# Altium schematic sheet 5V_and_3V3_Regulation.SchDoc
size 431 x 279 mm; SheetNumber: 2; SheetTotal: 5
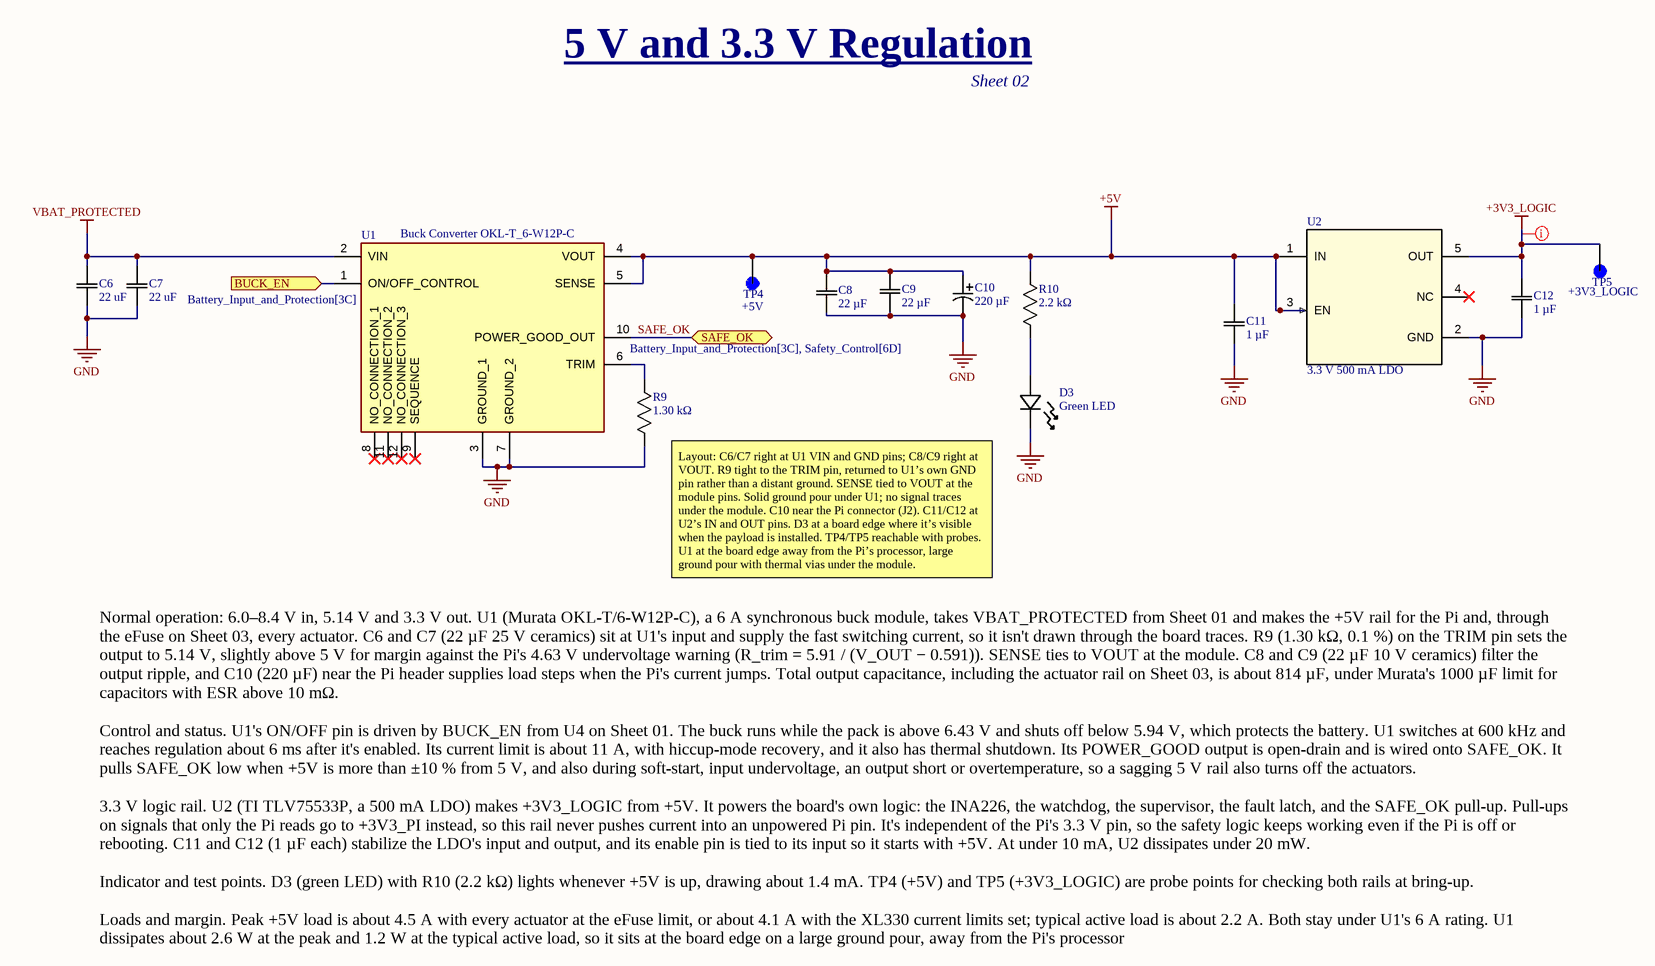
[diagram p0: 5V_and_3V3_Regulation.SchDoc]

## Parts
C6  22 uF  [G-32_MUR]
C7  22 uF  [G-32_MUR]
C8  22 µF  [CAP_GRM32ED_MUR]
C9  22 µF  [CAP_GRM32ED_MUR]
C10  220 µF  [CAP_EEFK_D_PAN]
C11  1 µF  [G-188_MUR]
C12  1 µF  [G-188_MUR]
D3  Green LED  [LED_LTST-C191KGKT_LTO]
R9  1.30 kΩ  [RC0603N_YAG]
R10  2.2 kΩ  [RC0603N_YAG]
TP4  +5V  [KEYSTONE_5015]
TP5  +3V3_LOGIC  [KEYSTONE_5015]
U1  Buck Converter OKL-T_6-W12P-C  [OKLT6W12PC]
U2  3.3 V 500 mA LDO  [DBV0005A_N]

## Ports
BUCK_EN (in, see Battery_Input_and_Protection[3C]), SAFE_OK (bidir, see Battery_Input_and_Protection[3C], Safety_Control[6D])

## Nets
+3V3_LOGIC: C12.1 TP5.TP U2.5(OUT)
+5V: C8.2 C9.2 C10.1 C11.1 R10.2 TP4.TP U1.4(VOUT) U1.5(SENSE) U2.1(IN) U2.3(EN)
GND: C6.2 C7.2 C8.1 C9.1 C10.2 C11.2 C12.2 D3.1(CATHODE) R9.2 U1.3(GROUND_1) U1.7(GROUND_2) U2.2(GND)
VBAT_PROTECTED: C6.1 C7.1 U1.2(VIN)
BUCK_EN: U1.1(ON/OFF_CONTROL) ; port BUCK_EN
SAFE_OK: U1.10(POWER_GOOD_OUT) ; port SAFE_OK
NetD3_2: D3.2(ANODE) R10.1
NetR9_1: R9.1 U1.6(TRIM)

Not connected (* = marked no-connect by the designer): U1 8(NO_CONNECTION_1)* 9(SEQUENCE)* 11(NO_CONNECTION_2)* 12(NO_CONNECTION_3)*; U2 4(NC)*

## Layout directives
net class POWER_LO: +3V3_LOGIC

## Notes on the sheet
- 5 V and 3.3 V Regulation
- Sheet 02
- Layout: C6/C7 right at U1 VIN and GND pins; C8/C9 right at VOUT. R9 tight to the TRIM pin, returned to U1’s own GND pin rather than a distant ground. SENSE tied to VOUT at the module pins. Solid ground pour under U1; no signal traces under the module. C10 near the Pi connector (J2). C11/C12 at U2’s IN and OUT pins. D3 at a board edge where it’s visible when the payload is installed. TP4/TP5 reachable with probes. U1 at the board edge away from the Pi’s processor, large ground pour with thermal vias under the module.
- Normal operation: 6.0–8.4 V in, 5.14 V and 3.3 V out. U1 (Murata OKL-T/6-W12P-C), a 6 A synchronous buck module, takes VBAT_PROTECTED from Sheet 01 and makes the +5V rail for the Pi and, through the eFuse on Sheet 03, every actuator. C6 and C7 (22 µF 25 V ceramics) sit at U1's input and supply the fast switching current, so it isn't drawn through the board traces. R9 (1.30 kΩ, 0.1 %) on the TRIM pin sets the output to 5.14 V, slightly above 5 V for margin against the Pi's 4.63 V undervoltage warning (R_trim = 5.91 / (V_OUT − 0.591)). SENSE ties to VOUT at the module. C8 and C9 (22 µF 10 V ceramics) filter the output ripple, and C10 (220 µF) near the Pi header supplies load steps when the Pi's current jumps. Total output capacitance, including the actuator rail on Sheet 03, is about 814 µF, under Murata's 1000 µF limit for capacitors with ESR above 10 mΩ.
  Control and status. U1's ON/OFF pin is driven by BUCK_EN from U4 on Sheet 01. The buck runs while the pack is above 6.43 V and shuts off below 5.94 V, which protects the battery. U1 switches at 600 kHz and reaches regulation about 6 ms after it's enabled. Its current limit is about 11 A, with hiccup-mode recovery, and it also has thermal shutdown. Its POWER_GOOD output is open-drain and is wired onto SAFE_OK. It pulls SAFE_OK low when +5V is more than ±10 % from 5 V, and also during soft-start, input undervoltage, an output short or overtemperature, so a sagging 5 V rail also turns off the actuators.
  3.3 V logic rail. U2 (TI TLV75533P, a 500 mA LDO) makes +3V3_LOGIC from +5V. It powers the board's own logic: the INA226, the watchdog, the supervisor, the fault latch, and the SAFE_OK pull-up. Pull-ups on signals that only the Pi reads go to +3V3_PI instead, so this rail never pushes current into an unpowered Pi pin. It's independent of the Pi's 3.3 V pin, so the safety logic keeps working even if the Pi is off or rebooting. C11 and C12 (1 µF each) stabilize the LDO's input and output, and its enable pin is tied to its input so it starts with +5V. At under 10 mA, U2 dissipates under 20 mW.
  Indicator and test points. D3 (green LED) with R10 (2.2 kΩ) lights whenever +5V is up, drawing about 1.4 mA. TP4 (+5V) and TP5 (+3V3_LOGIC) are probe points for checking both rails at bring-up.
  Loads and margin. Peak +5V load is about 4.5 A with every actuator at the eFuse limit, or about 4.1 A with the XL330 current limits set; typical active load is about 2.2 A. Both stay under U1's 6 A rating. U1 dissipates about 2.6 W at the peak and 1.2 W at the typical active load, so it sits at the board edge on a large ground pour, away from the Pi's processor
- DWG. NO.
- REV.
- SHT.
- THIS DOCUMENT AND THE DATA DISCLOSED HEREIN OR HEREWITH IS THE PROPERTY OF ALTIUM LIMITED AND MAY BE FREELY DISTRIBUTED IN WHOLE. NO RIGHTS ARE RESERVED OR EXPRESS OR IMPLIED WARANTEE GIVEN.
- REVISION
- DESCRIPTION
- DATE
- APPROVED
- ENG:
- APPROVALS
- PROJECT
- DSN:
- CHK:
- REFERENCE DOCUMENTS
- PROJECT REVISION:
- TITLE
- DOCUMENT REVISION:
- DESIGN ITEM:
- BOM:
- FAB DWG:
- PCB DWG:
- ASSY DWG:
- SCALE:
- SIZE
- B
- CAGE CODE
- FILE NAME
- DWG NO.
- SHEET
- OF
- REV

## Library data of the parts
C6 C7 = GRM32ER71E226KE15L: CAP, CERM, 22 uF, 25 V, +/- 10%, X7R, 1210 / Murata GRM32ER71E226KE15L / https://www.digikey.com/en/products/detail/murata-electronics/GRM32ER71E226KE15L/2039040; Copyright: Copyright (C) 2025 Ultra Librarian. All rights reserved.; Manufacturer_Name: Murata; Manufacturer_Part_Number: GRM32ER71E226KE15L
C8 C9 = GRM32ER71A226KE20L: Murata GRM32ER71A226KE20L / 22 µF 10 V X7R / https://www.digikey.com/en/products/detail/murata-electronics/GRM32ER71A226KE20L/586573; Copyright: Copyright (C) 2025 Ultra Librarian. All rights reserved.; Manufacturer_Name: Murata; Manufacturer_Part_Number: GRM32ER71A226KE20L
C10 = EEE-FK0J221P: Panasonic EEE-FK0J221P / 220 µF 6.3 V aluminum (total output C ≈ 734 µF, under the 1000 µF limit) / https://www.digikey.com/en/products/detail/panasonic-industry/EEE-FK0J221P/765937; Copyright: Copyright (C) 2026 Ultra Librarian. All rights reserved.; Manufacturer_Name: Panasonic; Manufacturer_Part_Number: EEE-FK0J221P
C11 C12 = GRM188R71A105KA61D: Murata GRM188R71A105KA61D / 1 µF 10 V X7R / https://www.digikey.com/en/products/detail/murata-electronics/GRM188R71A105KA61D/965913; Copyright: Copyright (C) 2025 Ultra Librarian. All rights reserved.; Manufacturer_Name: Murata; Manufacturer_Part_Number: GRM188R71A105KA61D
D3 = LTST-C191KGKT: Lite-On LTST-C191KGKT / Green LED / 0603 / https://www.digikey.com/en/products/detail/liteon/LTST-C191KGKT/386835; Type: LED Indication; Copyright: Copyright (C) 2025 Ultra Librarian. All rights reserved.; Manufacturer_Name: LITE-ON; Manufacturer_Part_Number: LTST-C191KGKT
R9 = RT0603BRD071K3L: Yageo RT0603BRD071K3L / 1.30 kΩ 0.1 % thin film (Murata asks ≤ 0.5 %, ≤ 100 ppm/°C) / 0603 / Output trim, 5.14 V / https://www.digikey.com/en/products/result?keywords=RT0603BRD071K3L; Copyright: Copyright (C) 2026 Ultra Librarian. All rights reserved.; Manufacturer_Name: Yageo; Manufacturer_Part_Number: RT0603BRD071K3L
R10 = RC0603FR-072K2L: RC0603FR-072K2L / 2.2 kΩ 1 % (~7 mW in D3) / 0603 / https://www.digikey.com/en/products/detail/yageo/RC0603FR-072K2L/727016; Manufacturer_Name: Yageo; Copyright: Copyright (C) 2025 Ultra Librarian. All rights reserved.; Manufacturer_Part_Number: RC0603FR-072K2L
TP4 TP5 = 5015: Test Point Micro Mini SMT Phos Bronze/Silver 1000pc Tape & Reel | Keystone Electronics 5015; SnapEDA_Link: https://www.snapeda.com/parts/5015/Keystone/view-part/?ref=snap; Package: None; Value: *; MF: Keystone Electronics; MP: 5015; Check_prices: https://www.snapeda.com/parts/5015/Keystone/view-part/?ref=eda
U1 = OKL-T_6-W12P-C: MURATA POWER SOLUTIONS - OKL-T/6-W12P-C - DC-DC CONVERTER, 0.591V TO 5.5V, MODULE; Manufacturer_Name: Murata Electronics; Geometry.Height: 7.2mm; Manufacturer_Part_Number: OKL-T/6-W12P-C; Mouser Part Number: 580-OKL-T/6-W12P-C; Mouser Price/Stock: https://www.mouser.co.uk/ProductDetail/Murata-Power-Solutions/OKL-T-6-W12P-C?qs=CxV9Ey7RZVdXGDAP%2FweYNg%3D%3D; Arrow Part Number: OKL-T/6-W12P-C; Arrow Price/Stock: https://www.arrow.com/en/products/okl-t6-w12p-c/murata-power-solutions?region=nac; Datasheet Link: https://www.murata.com/products/productdata/8807038255134/okl-t6-w12.pdf?1583754815000
U2 = TLV75533PDBVR: 500mA high-PSRR low-I<sub>Q</sub> low-dropout voltage regulator with enable 5-SOT-23 -40 to 125 / TI TLV75533PDBVR / 3.3 V 500 mA LDO / https://www.digikey.com/en/products/detail/texas-instruments/TLV75533PDBVR/9356541; Manufacturer_Name: Texas Instruments; TYPE: TYPE; RefDes: RefDes; Copyright: Copyright (C) 2026 Ultra Librarian. All rights reserved.; Manufacturer_Part_Number: TLV75533PDBVR